# EasyEDA Pro project IMPORT-THIS-IN-KICAD.epro, schematic Circuit
Board Name: Board1; Create Date: 2026-10-03; Page Name: P1; Project Name: Submission_Velan; Schematic Name: Schematic1; Update Date: 2026-10-03; Company: EasyEDA.com; Page Size: A4; Version: V1.0
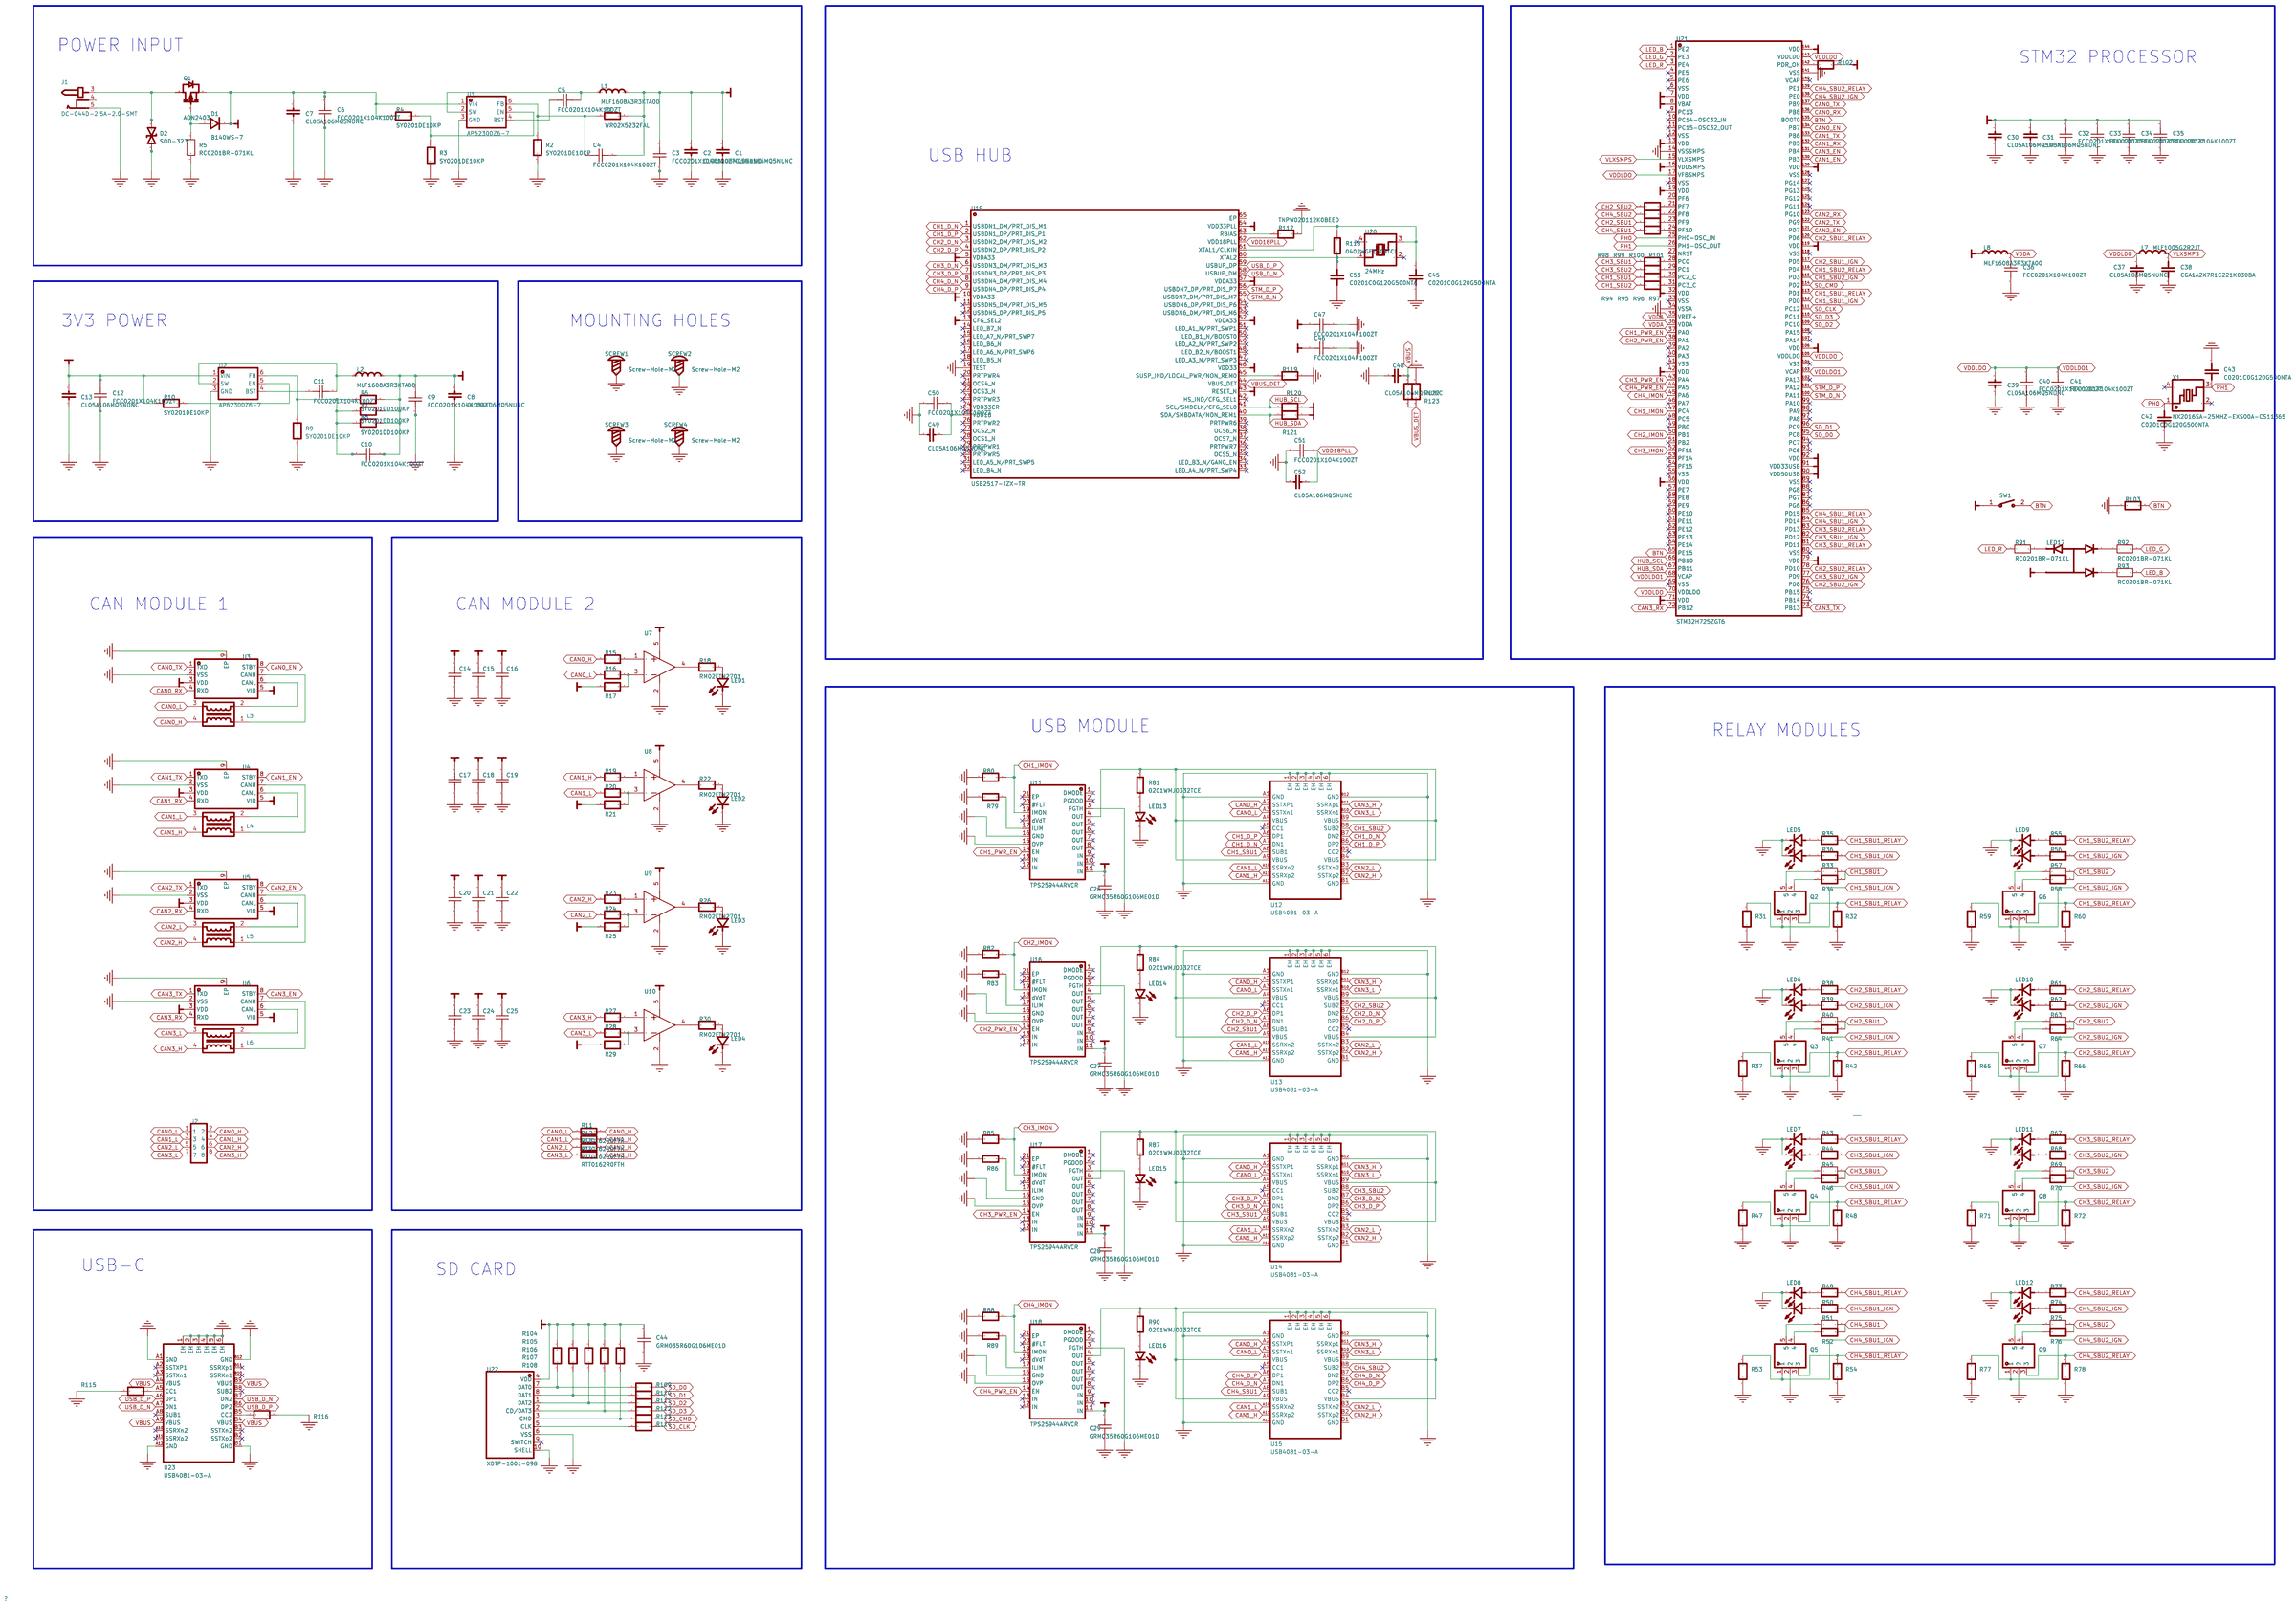
[diagram p0: schematic sheet]

## Parts
C1  10uF  [C0402]
C2  10uF  [C0402]
C3  100nF  [C0201]
C4  100nF  [C0201]
C5  100nF  [C0201]
C6  100nF  [C0201]
C7  10uF  [C0402]
C8  10uF  [C0402]
C9  100nF  [C0201]
C10  100nF  [C0201]
C11  100nF  [C0201]
C12  100nF  [C0201]
C13  10uF  [C0402]
C14  100nF  [C0201]
C15  100nF  [C0201]
C16  100nF  [C0201]
C17  100nF  [C0201]
C18  100nF  [C0201]
C19  100nF  [C0201]
C20  100nF  [C0201]
C21  100nF  [C0201]
C22  100nF  [C0201]
C23  100nF  [C0201]
C24  100nF  [C0201]
C25  100nF  [C0201]
C26  10uF  [C0201]
C27  10uF  [C0201]
C28  10uF  [C0201]
C29  10uF  [C0201]
C30  10uF  [C0402]
C31  10uF  [C0402]
C32  100nF  [C0201]
C33  100nF  [C0201]
C34  100nF  [C0201]
C35  100nF  [C0201]
C36  100nF  [C0201]
C37  10uF  [C0402]
C38  220pF  [C0201]
C39  10uF  [C0402]
C40  100nF  [C0201]
C41  100nF  [C0201]
C42  12pF  [C0201]
C43  12pF  [C0201]
C44  10uF  [C0201]
C45  12pF  [C0201]
C46  100nF  [C0201]
C47  100nF  [C0201]
C48  10uF  [C0402]
C49  10uF  [C0402]
C50  100nF  [C0201]
C51  100nF  [C0201]
C52  10uF  [C0402]
C53  12pF  [C0201]
D1  B140WS-7  [SOD-323_L1.8-W1.3-LS2.5-RD]
D2  SOD-323  [SOD-323_L1.7-W1.3-LS2.5-BI]
J1  DC-044D-2.5A-2.0-SMT  [DC-IN-SMD_DC-044D-2.5A-2.0-SMT]
J2  SSQ-104-04-T-D  [HDR-TH_8P-P2.54_SSW-104-23-F-D]
L1  3.3uH  [L0603]
L2  3.3uH  [L0603]
L3  ACM2012-900-2P-T001  [FILTER-SMD_4P-L2.0-W1.2-TL_ACM2012E]
L4  ACM2012-900-2P-T001  [FILTER-SMD_4P-L2.0-W1.2-TL_ACM2012E]
L5  ACM2012-900-2P-T001  [FILTER-SMD_4P-L2.0-W1.2-TL_ACM2012E]
L6  ACM2012-900-2P-T001  [FILTER-SMD_4P-L2.0-W1.2-TL_ACM2012E]
L7  2.2uH  [L0402]
L8  3.3uH  [L0603]
LED1  APHHS1005LSECK/J3-PF  [LED0402-RD_RED]
LED2  APHHS1005LSECK/J3-PF  [LED0402-RD_RED]
LED3  APHHS1005LSECK/J3-PF  [LED0402-RD_RED]
LED4  APHHS1005LSECK/J3-PF  [LED0402-RD_RED]
LED5  HSMF-C163  [LED-SMD_L1.6-W0.8_HSMF-C163]
LED6  HSMF-C163  [LED-SMD_L1.6-W0.8_HSMF-C163]
LED7  HSMF-C163  [LED-SMD_L1.6-W0.8_HSMF-C163]
LED8  HSMF-C163  [LED-SMD_L1.6-W0.8_HSMF-C163]
LED9  HSMF-C163  [LED-SMD_L1.6-W0.8_HSMF-C163]
LED10  HSMF-C163  [LED-SMD_L1.6-W0.8_HSMF-C163]
LED11  HSMF-C163  [LED-SMD_L1.6-W0.8_HSMF-C163]
LED12  HSMF-C163  [LED-SMD_L1.6-W0.8_HSMF-C163]
LED13  SLED-0603-H0_8MM_C9900013124  [LED0603-R-RD_RED]
LED14  SLED-0603-H0_8MM_C9900013124  [LED0603-R-RD_RED]
LED15  SLED-0603-H0_8MM_C9900013124  [LED0603-R-RD_RED]
LED16  SLED-0603-H0_8MM_C9900013124  [LED0603-R-RD_RED]
LED17  TZ1615RGB3U-Common Yang  [LED-SMD_TZ1615RGB3U-COMMON-YANG]
Q1  AON2403  [DFN-6_L2.0-W2.0-P0.65-BL-EP-1]
Q2  QS5K2TR  [SOT-23-5_L2.9-W1.6-P0.95-LS2.8-TL]
Q3  QS5K2TR  [SOT-23-5_L2.9-W1.6-P0.95-LS2.8-TL]
Q4  QS5K2TR  [SOT-23-5_L2.9-W1.6-P0.95-LS2.8-TL]
Q5  QS5K2TR  [SOT-23-5_L2.9-W1.6-P0.95-LS2.8-TL]
Q6  QS5K2TR  [SOT-23-5_L2.9-W1.6-P0.95-LS2.8-TL]
Q7  QS5K2TR  [SOT-23-5_L2.9-W1.6-P0.95-LS2.8-TL]
Q8  QS5K2TR  [SOT-23-5_L2.9-W1.6-P0.95-LS2.8-TL]
Q9  QS5K2TR  [SOT-23-5_L2.9-W1.6-P0.95-LS2.8-TL]
R1  52.3kΩ  [R0201]
R2  10kΩ  [R0201]
R3  10kΩ  [R0201]
R4  10kΩ  [R0201]
R5  1kΩ  [R0201]
R6  100kΩ  [R0201]
R7  100kΩ  [R0201]
R8  100kΩ  [R0201]
R9  10kΩ  [R0201]
R10  10kΩ  [R0201]
R11  62Ω  [R0201]
R12  62Ω  [R0201]
R13  62Ω  [R0201]
R14  62Ω  [R0201]
R15  10kΩ  [R0201]
R16  10kΩ  [R0201]
R17  100kΩ  [R0201]
R18  2.7kΩ  [R0201]
R19  10kΩ  [R0201]
R20  10kΩ  [R0201]
R21  100kΩ  [R0201]
R22  2.7kΩ  [R0201]
R23  10kΩ  [R0201]
R24  10kΩ  [R0201]
R25  100kΩ  [R0201]
R26  2.7kΩ  [R0201]
R27  10kΩ  [R0201]
R28  10kΩ  [R0201]
R29  100kΩ  [R0201]
R30  2.7kΩ  [R0201]
R31  10kΩ  [R0201]
R32  10kΩ  [R0201]
R33  1kΩ  [R0201]
R34  100Ω  [R0201]
R35  100Ω  [R0201]
R36  100Ω  [R0201]
R37  10kΩ  [R0201]
R38  100Ω  [R0201]
R39  100Ω  [R0201]
R40  1kΩ  [R0201]
R41  100Ω  [R0201]
R42  10kΩ  [R0201]
R43  100Ω  [R0201]
R44  100Ω  [R0201]
R45  1kΩ  [R0201]
R46  100Ω  [R0201]
R47  10kΩ  [R0201]
R48  10kΩ  [R0201]
R49  100Ω  [R0201]
R50  100Ω  [R0201]
R51  1kΩ  [R0201]
R52  100Ω  [R0201]
R53  10kΩ  [R0201]
R54  10kΩ  [R0201]
R55  100Ω  [R0201]
R56  100Ω  [R0201]
R57  1kΩ  [R0201]
R58  100Ω  [R0201]
R59  10kΩ  [R0201]
R60  10kΩ  [R0201]
R61  100Ω  [R0201]
R62  100Ω  [R0201]
R63  1kΩ  [R0201]
R64  100Ω  [R0201]
R65  10kΩ  [R0201]
R66  10kΩ  [R0201]
R67  100Ω  [R0201]
R68  100Ω  [R0201]
R69  1kΩ  [R0201]
R70  100Ω  [R0201]
R71  10kΩ  [R0201]
R72  10kΩ  [R0201]
R73  100Ω  [R0201]
R74  100Ω  [R0201]
R75  1kΩ  [R0201]
R76  100Ω  [R0201]
R77  10kΩ  [R0201]
R78  10kΩ  [R0201]
R79  28kΩ  [R0201]
R80  33kΩ  [R0201]
R81  3.3kΩ  [R0201]
R82  33kΩ  [R0201]
R83  28kΩ  [R0201]
R84  3.3kΩ  [R0201]
R85  33kΩ  [R0201]
R86  28kΩ  [R0201]
R87  3.3kΩ  [R0201]
R88  33kΩ  [R0201]
R89  28kΩ  [R0201]
R90  3.3kΩ  [R0201]
R91  1kΩ  [R0201]
R92  1kΩ  [R0201]
R93  1kΩ  [R0201]
R94  100kΩ  [R0201]
R95  100kΩ  [R0201]
R96  100kΩ  [R0201]
R97  100kΩ  [R0201]
R98  100kΩ  [R0201]
R99  100kΩ  [R0201]
R100  100kΩ  [R0201]
R101  100kΩ  [R0201]
R102  10kΩ  [R0201]
R103  10kΩ  [R0201]
R104  10kΩ  [R0201]
R105  10kΩ  [R0201]
R106  10kΩ  [R0201]
R107  10kΩ  [R0201]
R108  10kΩ  [R0201]
R109  0Ω  [R0201]
R110  0Ω  [R0201]
R111  0Ω  [R0201]
R112  0Ω  [R0201]
R113  0Ω  [R0201]
R114  0Ω  [R0201]
R115  10kΩ  [R0201]
R116  10kΩ  [R0201]
R117  12kΩ  [R0201]
R118  1MΩ  [R0402]
R119  10kΩ  [R0201]
R120  10kΩ  [R0201]
R121  10kΩ  [R0201]
R122  100kΩ  [R0201]
R123  100kΩ  [R0201]
SCREW1  Screw-Hole-M2  [Screw-Hole-M2]
SCREW2  Screw-Hole-M2  [Screw-Hole-M2]
SCREW3  Screw-Hole-M2  [Screw-Hole-M2]
SCREW4  Screw-Hole-M2  [Screw-Hole-M2]
SW1  TS-1809-T20  [SW-SMD_L3.9-W2.9-LS4.8SWQC_SPST]
U1  AP62300Z6-7  [SOT-563-6_L1.6-W1.2-P0.50-LS1.6-BL]
U2  AP62300Z6-7  [SOT-563-6_L1.6-W1.2-P0.50-LS1.6-BL]
U3  MCP2542FDT-E/MNY  [TDFN-8_L3.0-W2.0-P0.50-TL-EP]
U4  MCP2542FDT-E/MNY  [TDFN-8_L3.0-W2.0-P0.50-TL-EP]
U5  MCP2542FDT-E/MNY  [TDFN-8_L3.0-W2.0-P0.50-TL-EP]
U6  MCP2542FDT-E/MNY  [TDFN-8_L3.0-W2.0-P0.50-TL-EP]
U7  NCS20071XV53T2G  [SOT-553-5_L1.6-W1.2-P0.50-LS1.6-BL]
U8  NCS20071XV53T2G  [SOT-553-5_L1.6-W1.2-P0.50-LS1.6-BL]
U9  NCS20071XV53T2G  [SOT-553-5_L1.6-W1.2-P0.50-LS1.6-BL]
U10  NCS20071XV53T2G  [SOT-553-5_L1.6-W1.2-P0.50-LS1.6-BL]
U11  TPS25944ARVCR  [WQFN-20_L4.0-W3.0-P0.50-BL-EP]
U12  USB4081-03-A  [USB-SMD_USB4081-03-A]
U13  USB4081-03-A  [USB-SMD_USB4081-03-A]
U14  USB4081-03-A  [USB-SMD_USB4081-03-A]
U15  USB4081-03-A  [USB-SMD_USB4081-03-A]
U16  TPS25944ARVCR  [WQFN-20_L4.0-W3.0-P0.50-BL-EP]
U17  TPS25944ARVCR  [WQFN-20_L4.0-W3.0-P0.50-BL-EP]
U18  TPS25944ARVCR  [WQFN-20_L4.0-W3.0-P0.50-BL-EP]
U19  USB2517-JZX-TR  [QFN-64_L9.0-W9.0-P0.50-BL-EP4.8]
U20  24MHz  [CRYSTAL-SMD_4P-L3.2-W2.5-BL]
U21  STM32H725ZGT6  [LQFP-144_L20.0-W20.0-P0.50-LS22.0-BL]
U22  XDTP-1001-098  [MICRO-SD-SMD_XDTP-1001-098]
U23  USB4081-03-A  [USB-SMD_USB4081-03-A]
X1  25MHz  [CRYSTAL-SMD_4P-L2.0-W1.6-BL]

## Library data of the parts
C1 C2 C7 C8 C13 C30 C31 C37 C39 C48 C49 C52 = CL05A106MQ5NUNC: Capacitance:10uF Tolerance:±20% Tolerance:±20% Voltage Rating:6.3V Temperature Coefficient:X5R; LCSC Part Name: 10uF ±20% 6.3V; Supplier Part: C15525; Manufacturer: SAMSUNG(三星); Supplier Footprint: 0402; JLCPCB Part Class: Basic Part; Datasheet: https://item.szlcsc.com/datasheet/CL05A106MQ5NUNC/16204.html; Supplier: LCSC; Tolerance: ±20%; Voltage Rating: 6.3V; Temperature Coefficient: X5R
C3-C6 C9-C12 C14-C25 C32-C36 C40 C41 C46 C47 C50 C51 = FCC0201X104K100ZT: Capacitance:100nF Tolerance:±10% Tolerance:±10% Voltage Rating:10V Temperature Coefficient:X5R Operating Temperature:-55℃~+85℃ Operating Temperature:-55℃~+85℃; LCSC Part Name: 100nF ±10% 10V; Supplier Part: C7419414; Manufacturer: FOJAN(富捷); Supplier Footprint: 0201; JLCPCB Part Class: Extended Part; Datasheet: https://item.szlcsc.com/datasheet/FCC0201X104K100ZT/8393396.html; Supplier: LCSC; Tolerance: ±10%; Voltage Rating: 10V; Temperature Coefficient: X5R; Operating Temperature: -55℃~+85℃
C26-C29 C44 = GRM035R60G106ME01D: Capacitance:10uF Tolerance:±20% Tolerance:±20% Voltage Rating:4V Temperature Coefficient:X5R Operating Temperature:-55℃~+85℃ Operating Temperature:-55℃~+85℃; LCSC Part Name: 10uF ±20% 4V; Supplier Part: C53260764; Manufacturer: muRata(村田); Supplier Footprint: 0201; JLCPCB Part Class: Extended Part; Datasheet: https://item.szlcsc.com/datasheet/GRM035R60G106ME01D/56318658.html; Supplier: LCSC; Tolerance: ±20%; Voltage Rating: 4V; Temperature Coefficient: X5R; Operating Temperature: -55℃~+85℃
C38 = CGA1A2X7R1C221K030BA: Capacitance: Tolerance:±10% Tolerance:±10% Voltage Rated: Temperature Coefficient:; LCSC Part Name: 220pF ±10% 16V; Supplier Part: C2174633; Manufacturer: TDK; Supplier Footprint: 0201; JLCPCB Part Class: Extended Part; Datasheet: https://atta.szlcsc.com/upload/public/pdf/source/20210430/BD8671736ED62E65BA506F30C3AAED50.pdf; Supplier: LCSC; Tolerance: ±10%
C42 C43 C45 C53 = C0201C0G120G500NTA: Capacitance:12pF Tolerance:±2% Tolerance:±2% Voltage Rating:50V Temperature Coefficient:C0G; LCSC Part Name: 12pF ±2% 50V; Supplier Part: C778215; Manufacturer: EYANG(宇阳科技); Supplier Footprint: 0201; JLCPCB Part Class: Extended Part; Datasheet: https://item.szlcsc.com/datasheet/C0201C0G120G500NTA/826909.html; Supplier: LCSC; Tolerance: ±2%; Voltage Rating: 50V; Temperature Coefficient: C0G
D1 = B140WS-7: Diode Configuration:1 Independent Voltage - Forward(Vf@If):620mV@1A Voltage - DC Reverse(Vr):40V Current - Rectified:1A Reverse Leakage Current (Ir):50uA@40V Operating Junction Temperature Range:-40℃~+125℃ Operating Junction Temperature Range:-40℃~+125℃ N; LCSC Part Name: 电压:40V 电流:1A; Supplier Part: C95171; Manufacturer: DIODES(美台); Supplier Footprint: SOD-323; JLCPCB Part Class: Extended Part; Datasheet: https://item.szlcsc.com/datasheet/B140WS-7/96372.html; Supplier: LCSC; Diode Configuration: 1 Independent; Voltage - Forward(Vf@If): 620mV@1A; Voltage - DC Reverse(Vr): 40V; Current - Rectified: 1A; Reverse Leakage Current (Ir): 50uA@40V; Operating Junction Temperature Range: -40℃~+125℃; Non-Repetitive Peak Forward Surge Current: 3A
D2 = SOD-323: Supplier Part: C9900016728; JLCPCB Part Class: Extended Part; Supplier: LCSC
J1 = DC-044D-2.5A-2.0-SMT: Connector Type:DC Power Jack Mounting Type:Panel Mount Inside Contact Diameter:2mm Outside Contact Diameter:6mm Current Rating:2.5A Voltage Rating (Max):24V Body Height:7mm Length:13.5mm Width:11.6mm Operating Temperature:-20℃~+70℃ Operating Temperature:-; LCSC Part Name: DC电源插座 内径:2mm 外径:6mm; Supplier Part: C397342; Manufacturer: XKB Connection(中国星坤); Supplier Footprint: SMD; JLCPCB Part Class: Extended Part; Datasheet: https://item.szlcsc.com/datasheet/DC-044D-2.5A-2.0-SMT/378920.html; Supplier: LCSC; Connector Type: DC Power Jack; Mounting Type: Panel Mount; Inside Contact Diameter: 2mm; Outside Contact Diameter: 6mm; Current Rating: 2.5A; Voltage Rating (Max): 24V; Body Height: 7mm; Length: 13.5mm; Width: 11.6mm; Operating Temperature: -20℃~+70℃
J2 = SSQ-104-04-T-D: Pitch:2.54mm Row Spacing:2.54mm Mounting Type:Through Hole Number of Rows:2 Number of Positions:8P Voltage Rating (Max):- Insulation Height:8.51mm Contact Plating:Tin Operating Temperature:-55℃~+105℃ Operating Temperature:-55℃~+105℃; LCSC Part Name: 间距:2.54mm 直插; Supplier Part: C6685839; Manufacturer: SAMTEC; Supplier Footprint: 插件,P=2.54mm; JLCPCB Part Class: Extended Part; Datasheet: https://item.szlcsc.com/datasheet/SSQ-104-04-T-D/7641055.html; Supplier: LCSC; Pitch: 2.54mm; Row Spacing: 2.54mm; Mounting Type: Through Hole; Number of Rows: 2; Number of Positions: 8P; Insulation Height: 8.51mm; Contact Plating: Tin; Operating Temperature: -55℃~+105℃
L1 L2 L8 = MLF1608A3R3KTA00: Inductance:3.3uH Tolerance:±10% Tolerance:±10% Current Rating:30mA Current - Saturation (Isat):- DC Resistance(DCR):550mΩ Q @ Frequency:35@10MHz Frequency - Self Resonant:65MHz Ratings:-; LCSC Part Name: 3.3uH ±10%; Supplier Part: C574026; Manufacturer: TDK; Supplier Footprint: 0603; JLCPCB Part Class: Extended Part; Datasheet: https://item.szlcsc.com/datasheet/MLF1608A3R3KTA00/601954.html; Supplier: LCSC; Tolerance: ±10%; Current Rating: 30mA; DC Resistance(DCR): 550mΩ; Q @ Frequency: 35@10MHz; Frequency - Self Resonant: 65MHz
L3-L6 = ACM2012-900-2P-T001: Number of Lines:2 Inductance @ Frequency:- Current Rating:400mA Impedance @ Frequency:90Ω@100MHz Voltage Rating - DC:50V Voltage Withstand:- DC Resistance(DCR):190mΩ Operating Temperature:-40℃~+105℃ Operating Temperature:-40℃~+105℃ Insulation Resistance(I; LCSC Part Name: 两路 贴片共模滤波器 阻抗90Ω@100MHz; Supplier Part: C307642; Manufacturer: TDK; Supplier Footprint: SMD,2x1.2mm; JLCPCB Part Class: Extended Part; Datasheet: https://item.szlcsc.com/datasheet/ACM2012-900-2P-T001/291316.html; Supplier: LCSC; Number of Lines: 2; Current Rating: 400mA; Impedance @ Frequency: 90Ω@100MHz; Voltage Rating - DC: 50V; DC Resistance(DCR): 190mΩ; Operating Temperature: -40℃~+105℃; Insulation Resistance(IR): 10MΩ
L7 = MLF1005G2R2JT: Inductance: Tolerance:±5% Tolerance:±5% Rated Current: Saturation Current (Isat):- DC Resistance (DCR): Q @ Freq:30@10MHz Frequency - Self Resonant:80MHz Ratings:; LCSC Part Name: 2.2uH ±5%; Supplier Part: C2049077; Manufacturer: TDK; Supplier Footprint: 0402; JLCPCB Part Class: Extended Part; Datasheet: https://atta.szlcsc.com/upload/public/pdf/source/20210630/1671E6FFEDD46C2DFBE7E714E5EDDF5E.pdf; Supplier: LCSC; Tolerance: ±5%; Q @ Freq: 30@10MHz; Frequency - Self Resonant: 80MHz
LED1-LED4 = APHHS1005LSECK/J3-PF: Lamp Holder Type:- Illumination Color:Red Voltage - Forward(Vf):1.8V Voltage - Forward(Vf):1.8V Power(Watts):84mW Forward Current:2mA Wavelength - Dominant:625nm Wavelength - Dominant:625nm Peak Wavelength:640nm Diode Configuration:Discrete Diode Lens Col; LCSC Part Name: 1.0x0.5 mm贴片式芯片LED灯; Supplier Part: C5354976; Manufacturer: Kingbright(今台); Supplier Footprint: 0402; JLCPCB Part Class: Extended Part; Datasheet: https://item.szlcsc.com/datasheet/APHHS1005LSECK%252FJ3-PF/6154435.html; Supplier: LCSC; Illumination Color: Red; Voltage - Forward(Vf): 1.8V; Power(Watts): 84mW; Forward Current: 2mA; Wavelength - Dominant: 625nm; Peak Wavelength: 640nm; Diode Configuration: Discrete Diode; Lens Color: Water Clear; Luminous Intensity: 80mcd; Viewing Angle: 120°; Operating Temperature: -40℃~+85℃
LED5-LED12 = HSMF-C163: Lamp Holder Type:1.6mm x 0.8mm square LED Illumination Color:Red, Emerald Green Voltage - Forward(Vf):1.9V；3.4V Voltage - Forward(Vf):1.9V；3.4V Power(Watts):48mW；38mW Test Current:10mA；20mA Wavelength - Dominant:626nm；525nm Wavelength - Dominant:626nm；525; LCSC Part Name: 小型双色表面贴装芯片LED，适用于手机和移动设备背光及指示，有多种颜色组合，兼容回流焊; Supplier Part: C6273803; Manufacturer: Broadcom(博通); Supplier Footprint: 0603; JLCPCB Part Class: Extended Part; Datasheet: https://item.szlcsc.com/datasheet/HSMF-C163/7219819.html; Supplier: LCSC; Lamp Holder Type: 1.6mm x 0.8mm square LED; Illumination Color: Red, Emerald Green; Voltage - Forward(Vf): 1.9V；3.4V; Power(Watts): 48mW；38mW; Test Current: 10mA；20mA; Wavelength - Dominant: 626nm；525nm; Peak Wavelength: 637nm；523nm; Lens Color: White Lens; Luminous Intensity: 90mcd；45mcd; Viewing Angle: 120°; Operating Temperature: -40℃~+85℃
LED13-LED16 = SLED-0603-H0_8MM_C9900013124: LCSC Part Name: SLED-0603-H0_8MM; Supplier Part: C9900013124; Manufacturer Part: SLED-0603-H0_8MM; Supplier Footprint: LED0603_Red; JLCPCB Part Class: Extended Part; Supplier: LCSC
LED17 = TZ1615RGB3U-Common Yang: Illumination Color:Red, Emerald Green, Blue Voltage - Forward(Vf):2.6V~3V；1.8V~2.1V；2.4V~2.8V Voltage - Forward(Vf):2.6V~3V；1.8V~2.1V；2.4V~2.8V Power(Watts):60mW；90mW；90mW Forward Current:30mA Wavelength - Dominant:520nm~523nm；466nm~469nm；620nm~625nm Wave; LCSC Part Name: 红灯,翠绿，蓝灯 光强200mcd;1000mcd;300mcd; Supplier Part: C5331632; Manufacturer: TUOZHAN(拓展光电); Supplier Footprint: SMD,1.5x1.6mm; JLCPCB Part Class: Extended Part; Datasheet: https://item.szlcsc.com/datasheet/TZ1615RGB3U-Common%2520Yang/6091971.html; Supplier: LCSC; Illumination Color: Red, Emerald Green, Blue; Voltage - Forward(Vf): 2.6V~3V；1.8V~2.1V；2.4V~2.8V; Power(Watts): 60mW；90mW；90mW; Forward Current: 30mA; Wavelength - Dominant: 520nm~523nm；466nm~469nm；620nm~625nm; Luminous Intensity: 1000mcd；300mcd；200mcd; Viewing Angle: 120°; Operating Temperature: -40℃~+80℃
Q1 = AON2403: Number:1 P-Channel Drain to Source Voltage:12V Current - Continuous Drain(Id):8A RDS(on):21mΩ@4.5V Pd - Power Dissipation:2.8W Gate Threshold Voltage (Vgs(th)):900mV Gate Charge(Qg):18nC@4.5V Input Capacitance(Ciss):1.37nF Reverse Transfer Capacitance (Cr; LCSC Part Name: 1个P沟道 耐压:12V; Supplier Part: C2931059; Manufacturer: AOS; Supplier Footprint: DFN-6-EP(2x2); JLCPCB Part Class: Extended Part; Datasheet: https://item.szlcsc.com/datasheet/AON2403/3270195.html; Supplier: LCSC; Number: 1 P-Channel; Drain to Source Voltage: 12V; Current - Continuous Drain(Id): 8A; RDS(on): 21mΩ@4.5V; Pd - Power Dissipation: 2.8W; Gate Threshold Voltage (Vgs(th)): 900mV; Gate Charge(Qg): 18nC@4.5V; Input Capacitance(Ciss): 1.37nF; Reverse Transfer Capacitance (Crss@Vds): 258pF; Operating Temperature: -55℃~+150℃; Type: P-Channel; Output Capacitance(Coss): 350pF; Vgs: ±8V
Q2-Q9 = QS5K2TR: Number:2 N-Channel Drain to Source Voltage:30V Current - Continuous Drain(Id):2A RDS(on):154mΩ@2.5V Pd - Power Dissipation:1.25W Gate Threshold Voltage (Vgs(th)):1.5V Gate Charge(Qg):3.9nC@15V Input Capacitance(Ciss):175pF Reverse Transfer Capacitance (Cr; LCSC Part Name: 2个N沟道 耐压:30V 电流:2A; Supplier Part: C2889124; Manufacturer: ROHM(罗姆); Supplier Footprint: SOT-23-5; JLCPCB Part Class: Extended Part; Datasheet: https://item.szlcsc.com/datasheet/QS5K2TR/3109776.html; Supplier: LCSC; Number: 2 N-Channel; Drain to Source Voltage: 30V; Current - Continuous Drain(Id): 2A; RDS(on): 154mΩ@2.5V; Pd - Power Dissipation: 1.25W; Gate Threshold Voltage (Vgs(th)): 1.5V; Gate Charge(Qg): 3.9nC@15V; Input Capacitance(Ciss): 175pF; Reverse Transfer Capacitance (Crss@Vds): 25pF; Operating Temperature: -55℃~+150℃; Configuration: Common source; Type: N-Channel; Output Capacitance(Coss): 50pF; Vgs: ±12V
R1 = WR02X5232FAL: Type:Thick Film Resistors Resistance: Tolerance:±1% Tolerance:±1% Power(Watts): Overload Voltage (Max): Temperature Coefficient:±200ppm/℃ Temperature Coefficient:±200ppm/℃ Operating Temperature Range:-55℃~+125℃ Operating Temperature Range:-55℃~+125℃; LCSC Part Name: 厚膜电阻 52.3kΩ ±1% 50mW; Supplier Part: C180337; Manufacturer: Walsin(华新科); Supplier Footprint: 0201; JLCPCB Part Class: Extended Part; Datasheet: https://atta.szlcsc.com/upload/public/pdf/source/20190904/C424794_2044F9DA5DA8A0E175B1DF2F17C06127.pdf; Supplier: LCSC; Type: Thick Film Resistors; Tolerance: ±1%; Temperature Coefficient: ±200ppm/℃; Operating Temperature Range: -55℃~+125℃
R2-R4 R9 R10 R15 R16 R19 R20 R23 R24 R27 R28 R31 R32 R37 R42 R47 R48 R53 R54 R59 R60 R65 R66 R71 R72 R77 R78 R102-R108 R115 R116 R119-R121 = SY0201DE10KP: Type:Thick Film Resistors Resistance: Tolerance:±0.5% Tolerance:±0.5% Power(Watts):- Overload Voltage (Max):- Temperature Coefficient:±50ppm/℃ Temperature Coefficient:±50ppm/℃ Operating Temperature Range:-55℃~+125℃ Operating Temperature Range:-55℃~+125℃; LCSC Part Name: 厚膜电阻 10kΩ ±0.5%; Supplier Part: C2763758; Manufacturer: SANYEAR(叁叶源); Supplier Footprint: 0201; JLCPCB Part Class: Extended Part; Datasheet: https://atta.szlcsc.com/upload/public/pdf/source/20210413/C2763786_98157E1BD2D9D1A8B4147C58C12D38F2.pdf; Supplier: LCSC; Type: Thick Film Resistors; Tolerance: ±0.5%; Temperature Coefficient: ±50ppm/℃; Operating Temperature Range: -55℃~+125℃
R5 R33 R40 R45 R51 R57 R63 R69 R75 R91-R93 = RC0201BR-071KL: Type:Thick Film Resistor Resistance:1kΩ Tolerance:±0.1% Tolerance:±0.1% Power(Watts):50mW Temperature Coefficient:±200ppm/℃ Temperature Coefficient:±200ppm/℃ Operating Temperature:-55℃~+125℃ Operating Temperature:-55℃~+125℃; LCSC Part Name: 厚膜电阻 1kΩ ±0.1% 50mW; Supplier Part: C20161128; Manufacturer: YAGEO(国巨); Supplier Footprint: 0201; JLCPCB Part Class: Extended Part; Datasheet: https://item.szlcsc.com/datasheet/RC0201BR-071KL/21487095.html; Supplier: LCSC; Type: Thick Film Resistor; Tolerance: ±0.1%; Power(Watts): 50mW; Temperature Coefficient: ±200ppm/℃; Operating Temperature: -55℃~+125℃
R6-R8 R17 R21 R25 R29 R94-R101 R122 R123 = SY0201DD100KP: Type:Thick Film Resistors Resistance:100kΩ Tolerance:±0.5% Tolerance:±0.5% Power(Watts):- Voltage-Supply(Max):- Temperature Coefficient:±25ppm/℃ Temperature Coefficient:±25ppm/℃ Operating Temperature:-55℃~+125℃ Operating Temperature:-55℃~+125℃; LCSC Part Name: 厚膜电阻 100kΩ ±0.5%; Supplier Part: C2763725; Manufacturer: SANYEAR(叁叶源); Supplier Footprint: 0201; JLCPCB Part Class: Extended Part; Datasheet: https://atta.szlcsc.com/upload/public/pdf/source/20210413/C2763786_98157E1BD2D9D1A8B4147C58C12D38F2.pdf; Supplier: LCSC; Type: Thick Film Resistors; Tolerance: ±0.5%; Temperature Coefficient: ±25ppm/℃; Operating Temperature: -55℃~+125℃
R11-R14 = RTT0162R0FTH: Type:Thick Film Resistor Resistance:62Ω Tolerance:±1% Tolerance:±1% Power(Watts):50mW Voltage-Supply(Max):25V Temperature Coefficient:±200ppm/℃ Temperature Coefficient:±200ppm/℃ Operating Temperature:-55℃~+125℃ Operating Temperature:-55℃~+125℃; LCSC Part Name: 厚膜电阻 62Ω ±1% 50mW; Supplier Part: C158403; Manufacturer: RALEC(旺诠); Supplier Footprint: 0201; JLCPCB Part Class: Extended Part; Datasheet: https://item.szlcsc.com/datasheet/RTT0162R0FTH/169756.html; Supplier: LCSC; Type: Thick Film Resistor; Tolerance: ±1%; Power(Watts): 50mW; Voltage-Supply(Max): 25V; Temperature Coefficient: ±200ppm/℃; Operating Temperature: -55℃~+125℃
R18 R22 R26 R30 = RM02FTN2701: Resistance:2.7kΩ Tolerance:±1% Tolerance:±1% Power(Watts):50mW Temperature Coefficient:±200ppm/℃ Temperature Coefficient:±200ppm/℃; LCSC Part Name: 2.7kΩ ±1% 50mW; Supplier Part: C239998; Manufacturer: 大毅科技; Supplier Footprint: 0201; JLCPCB Part Class: Extended Part; Datasheet: https://item.szlcsc.com/datasheet/RM02FTN2701/239089.html; Supplier: LCSC; Tolerance: ±1%; Power(Watts): 50mW; Temperature Coefficient: ±200ppm/℃
R34-R36 R38 R39 R41 R43 R44 R46 R49 R50 R52 R55 R56 R58 R61 R62 R64 R67 R68 R70 R73 R74 R76 = CR0201J100RQ15Z: Type:Thick Film Resistor Resistance:100Ω Tolerance:±5% Tolerance:±5% Power(Watts):50mW Voltage-Supply(Max):25V Temperature Coefficient:±200ppm/℃ Temperature Coefficient:±200ppm/℃ Operating Temperature:-55℃~+155℃ Operating Temperature:-55℃~+155℃; LCSC Part Name: 厚膜电阻 100Ω ±5% 50mW; Supplier Part: C881230; Manufacturer: EVER OHMS(天二科技); Supplier Footprint: 0201; JLCPCB Part Class: Extended Part; Datasheet: https://item.szlcsc.com/datasheet/CR0201J100RQ15Z/944145.html; Supplier: LCSC; Type: Thick Film Resistor; Tolerance: ±5%; Power(Watts): 50mW; Voltage-Supply(Max): 25V; Temperature Coefficient: ±200ppm/℃; Operating Temperature: -55℃~+155℃
R79 R83 R86 R89 = RC-01W2802FT: Type:Thick Film Resistor Resistance:28kΩ Tolerance:±1% Tolerance:±1% Power(Watts):50mW Voltage-Supply(Max):25V Temperature Coefficient:±200ppm/℃ Temperature Coefficient:±200ppm/℃ Operating Temperature:-55℃~+125℃ Operating Temperature:-55℃~+125℃; LCSC Part Name: 厚膜电阻 28kΩ ±1% 50mW; Supplier Part: C320804; Manufacturer: FH(风华); Supplier Footprint: 0201; JLCPCB Part Class: Extended Part; Datasheet: https://item.szlcsc.com/datasheet/RC-01W2802FT/301709.html; Supplier: LCSC; Type: Thick Film Resistor; Tolerance: ±1%; Power(Watts): 50mW; Voltage-Supply(Max): 25V; Temperature Coefficient: ±200ppm/℃; Operating Temperature: -55℃~+125℃
R80 R82 R85 R88 = AC0201FR-0733KL: Type:Thick Film Resistors Resistance: Tolerance:±1% Tolerance:±1% Power(Watts): Overload Voltage (Max): Temperature Coefficient:±200ppm/℃ Temperature Coefficient:±200ppm/℃ Operating Temperature Range:-55℃~+155℃ Operating Temperature Range:-55℃~+155℃; LCSC Part Name: 厚膜电阻 33kΩ ±1% 50mW; Supplier Part: C226512; Manufacturer: YAGEO(国巨); Supplier Footprint: 0201; JLCPCB Part Class: Extended Part; Datasheet: https://atta.szlcsc.com/upload/public/pdf/source/20200817/C226512_B606B44C9E13D1181CAA89D1E1529F40.pdf; Supplier: LCSC; Type: Thick Film Resistors; Tolerance: ±1%; Temperature Coefficient: ±200ppm/℃; Operating Temperature Range: -55℃~+155℃
R81 R84 R87 R90 = 0201WMJ0332TCE: Type:Thick Film Resistors Resistance:3.3kΩ Tolerance:±5% Tolerance:±5% Power(Watts): Overload Voltage (Max): Temperature Coefficient:±200ppm/℃ Temperature Coefficient:±200ppm/℃ Operating Temperature Range:-55℃~+155℃ Operating Temperature Range:-55℃~+155℃; LCSC Part Name: 3.3kΩ ±5% 50mW 厚膜电阻; Supplier Part: C25843; Manufacturer: UNI-ROYAL(厚声); Supplier Footprint: 0201; JLCPCB Part Class: Extended Part; Datasheet: https://atta.szlcsc.com/upload/public/pdf/source/20200306/C422600_1E6D84923E4A46A82E41ADD87F860B5C.pdf; Supplier: LCSC; Type: Thick Film Resistors; Tolerance: ±5%; Temperature Coefficient: ±200ppm/℃; Operating Temperature Range: -55℃~+155℃
R109-R114 = CR0201J0R00Q15Z: Type:Thick Film Resistors Resistance: Tolerance:±5% Tolerance:±5% Power(Watts):- Operating Temperature Range:-55℃~+155℃ Operating Temperature Range:-55℃~+155℃; LCSC Part Name: 厚膜电阻 0Ω ±5%; Supplier Part: C881221; Manufacturer: EVER OHMS(天二科技); Supplier Footprint: 0201; JLCPCB Part Class: Extended Part; Datasheet: https://atta.szlcsc.com/upload/public/pdf/source/20201014/C881429_ABC29D63C8D6A11EB63D87348B25AA7B.pdf; Supplier: LCSC; Type: Thick Film Resistors; Tolerance: ±5%; Operating Temperature Range: -55℃~+155℃
R117 = TNPW020112K0BEED: Type:Thin Film Resistor Resistance:12kΩ Tolerance:±0.1% Tolerance:±0.1% Power(Watts):75mW Voltage-Supply(Max):25V Temperature Coefficient:±25ppm/℃ Temperature Coefficient:±25ppm/℃ Operating Temperature:-55℃~+155℃ Operating Temperature:-55℃~+155℃; LCSC Part Name: 薄膜电阻 12kΩ ±0.1% 75mW; Supplier Part: C1857712; Manufacturer: VISHAY(威世); Supplier Footprint: 0201; JLCPCB Part Class: Extended Part; Datasheet: https://item.szlcsc.com/datasheet/TNPW020112K0BEED/1948525.html; Supplier: LCSC; Type: Thin Film Resistor; Tolerance: ±0.1%; Power(Watts): 75mW; Voltage-Supply(Max): 25V; Temperature Coefficient: ±25ppm/℃; Operating Temperature: -55℃~+155℃
R118 = 0402WGF1004TCE: Type:Thick Film Resistor Resistance:1MΩ Tolerance:±1% Tolerance:±1% Power(Watts):62.5mW Voltage-Supply(Max):50V Temperature Coefficient:±100ppm/℃ Temperature Coefficient:±100ppm/℃ Operating Temperature:-55℃~+155℃ Operating Temperature:-55℃~+155℃; LCSC Part Name: 1MΩ ±1% 62.5mW 厚膜电阻; Supplier Part: C26083; Manufacturer: UNI-ROYAL(厚声); Supplier Footprint: 0402; JLCPCB Part Class: Basic Part; Datasheet: https://item.szlcsc.com/datasheet/0402WGF1004TCE/26826.html; Supplier: LCSC; Type: Thick Film Resistor; Tolerance: ±1%; Power(Watts): 62.5mW; Voltage-Supply(Max): 50V; Temperature Coefficient: ±100ppm/℃; Operating Temperature: -55℃~+155℃
SCREW1-SCREW4 = Screw-Hole-M2: Supplier Footprint: 插件
SW1 = TS-1809-T20: Supplier Part: C9900021414; Supplier Footprint: SWQC_SPST_2P; JLCPCB Part Class: Extended Part; Supplier: LCSC
U1 U2 = AP62300Z6-7: Function:Step-down type Voltage - Supply:4.2V~18V Voltage - Supply:4.2V~18V Output Voltage:800mV~7V Output Voltage:800mV~7V Output Current:3A Frequency - Switching:750kHz Frequency - Switching:750kHz Operating Temperature:-40℃~+125℃ Operating Temperature:; LCSC Part Name: 降压型 3A 4.2V~18V; Supplier Part: C5250745; Manufacturer: DIODES(美台); Supplier Footprint: SOT-563; JLCPCB Part Class: Extended Part; Datasheet: https://item.szlcsc.com/datasheet/AP62300Z6-7/5966438.html; Supplier: LCSC; Function: Step-down type; Voltage - Supply: 4.2V~18V; Output Voltage: 800mV~7V; Output Current: 3A; Frequency - Switching: 750kHz; Operating Temperature: -40℃~+125℃; Synchronous Rectifier: Yes; Number of Outputs: 1; Topology: Buck; Quiescent Current: 155uA; Switch tube (built-in/external): Built-in; Output Type: Adjustable; Features: Light load efficient mode；Cycle-by-cycle current limiting；Overcurrent Protection；EMI optimization (spread spectrum)；Hiccup current limiting
U3-U6 = MCP2542FDT-E/MNY: Type:CAN FD Transceiver Data Rate:8Mbps Voltage - Supply:4.5V~5.5V Voltage - Supply:4.5V~5.5V Current - Supply:70mA Operating Temperature:-40℃~+125℃ Operating Temperature:-40℃~+125℃ Number of Channels:1 Quiescent Supply Current:16uA Features:Short-Circuit; LCSC Part Name: 带有唤醒模式选项的CAN FD收发器; Supplier Part: C114028; Manufacturer: MICROCHIP(美国微芯); Supplier Footprint: TDFN-8-EP(2x3); JLCPCB Part Class: Extended Part; Datasheet: https://item.szlcsc.com/datasheet/MCP2542FDT-E%252FMNY/115267.html; Supplier: LCSC; Type: CAN FD Transceiver; Data Rate: 8Mbps; Voltage - Supply: 4.5V~5.5V; Current - Supply: 70mA; Operating Temperature: -40℃~+125℃; Number of Channels: 1; Quiescent Supply Current: 16uA; Features: Short-Circuit  Protection；Wake-up function；Thermal shutdown protection；Undervoltage Protection；ESD protection；TXD dominant timeout；Low-power mode；Bus fault protection
U7-U10 = NCS20071XV53T2G: Number of Channels:1 Rail to Rail:Rail-to-rail output Gain Bandwidth Product:3MHz Vos - Input Offset Voltage:4.5mV Input Offset Voltage Drift(Vos TC):4uV/℃ Slew Rate:2.8V/us Ib - Input Bias Current:200pA Input Offset Current(Ios):2pA Input Voltage Noise D; LCSC Part Name: Operational Amplifier,Wide supply range,3MHz CMOS Op-Amp; Supplier Part: C5209282; Manufacturer: onsemi(安森美); Supplier Footprint: SOT-553; JLCPCB Part Class: Extended Part; Datasheet: https://item.szlcsc.com/datasheet/NCS20071XV53T2G/5902129.html; Supplier: LCSC; Number of Channels: 1; Rail to Rail: Rail-to-rail output; Gain Bandwidth Product: 3MHz; Vos - Input Offset Voltage: 4.5mV; Input Offset Voltage Drift(Vos TC): 4uV/℃; Slew Rate: 2.8V/us; Ib - Input Bias Current: 200pA; Input Offset Current(Ios): 2pA; Input Voltage Noise Density: 30nV/√Hz@1kHz; Common Mode Rejection Ratio(CMRR): 135dB; Quiescent Current: 420uA; Output Current: 50mA; Operating Temperature: -40℃~+125℃; Single supply: 2.7V~36V; Dual Supply: -18V~-1.35V；1.35V~18V; Features: ESD protection
U11 U16-U18 = TPS25944ARVCR: Output Type:Open-drain Voltage - Supply:2.7V~18V Voltage - Supply:2.7V~18V Reset Active Level:Active Low Number of Voltages Monitored:1 Reset Timeout:220us Operating Temperature:-40℃~+85℃ Operating Temperature:-40℃~+85℃ Function:Watchdog timer Quiescent C; LCSC Part Name: 2.7V至18V工作电压eFuse电源多路复用器，具备保护功能和双向电流控制; Supplier Part: C140313; Manufacturer: TI(德州仪器); Supplier Footprint: WQFN-20-EP(3x4); JLCPCB Part Class: Extended Part; Datasheet: https://www.ti.com/cn/lit/ds/symlink/tps25942a.pdf; Supplier: LCSC; Output Type: Open-drain; Voltage - Supply: 2.7V~18V; Reset Active Level: Active Low; Number of Voltages Monitored: 1; Reset Timeout: 220us; Operating Temperature: -40℃~+85℃; Function: Watchdog timer; Quiescent Current: 200uA
U12-U15 U23 = USB4081-03-A: Supplier Part: C7469868; Supplier Footprint: 插件; JLCPCB Part Class: Extended Part; Datasheet: https://item.szlcsc.com/datasheet/USB4081-03-A/8520767.html; Supplier: LCSC
U19 = USB2517-JZX-TR: type:Hub USB Protocol:USB 2.0 Data Rate:480Mbps Voltage - Supply:- Voltage - Supply:- Operating Temperature:- Operating Temperature:- Memory Interface:I2C Current - Supply:- Quiescent Supply Current:- Number of Channels:7 Features:Programmable signal driv; LCSC Part Name: USB 2.0高速7端口集线器控制器; Supplier Part: C626668; Manufacturer: MICROCHIP(美国微芯); Supplier Footprint: QFN-64-EP(9x9); JLCPCB Part Class: Extended Part; Datasheet: https://item.szlcsc.com/datasheet/USB2517-JZX-TR/656575.html; Supplier: LCSC; type: Hub; USB Protocol: USB 2.0; Data Rate: 480Mbps; Memory Interface: I2C; Number of Channels: 7; Features: Programmable signal drive；Internal regulator；Port power switch control；ESD protection；Power-on reset
U20 = 24MHz: Supplier Part: C9900010233; Supplier Footprint: 3225; JLCPCB Part Class: Extended Part; Supplier: LCSC
U21 = STM32H725ZGT6: CPU Core:ARM Cortex-M7 CPU Maximum Speed:550MHz Core Size:32 Bit Program Storage Size:1MB Program Memory Type:FLASH RAM Size:564KB EEPROM:- Number of I/O:97 Oscillator Type:Built-in Voltage - Supply:1.62V~3.6V Voltage - Supply:1.62V~3.6V Operating Tempera; LCSC Part Name: 高性能和带 DP-FPU 的 DSP、1 MByte 闪存的 Arm Cortex-M7 微控制器、564 KBytes RAM、550 MHz CPU、L1 缓存、外部内存接口、SMPS、部分外设子集; Supplier Part: C730156; Manufacturer: ST(意法半导体); Supplier Footprint: LQFP-144(20x20); JLCPCB Part Class: Extended Part; Datasheet: https://item.szlcsc.com/datasheet/STM32H725ZGT6/778111.html; Supplier: LCSC; CPU Core: ARM Cortex-M7; CPU Maximum Speed: 550MHz; Core Size: 32 Bit; Program Storage Size: 1MB; Program Memory Type: FLASH; RAM Size: 564KB; Number of I/O: 97; Oscillator Type: Built-in; Voltage - Supply: 1.62V~3.6V; Operating Temperature: -40℃~+85℃
U22 = XDTP-1001-098: Card Connection Mode:Push-Push Card Type:MicroSD Card (TF Card) Connector Type:Connector and Ejector Additional Card Detection Pins:No Height Above Board:1.85mm Operating Temperature:-45℃~+80℃ Operating Temperature:-45℃~+80℃; LCSC Part Name: 自弹式 MicroSD卡(TF卡) 卡座; Supplier Part: C7498123; Manufacturer: LX(连欣科技); Supplier Footprint: SMD; JLCPCB Part Class: Extended Part; Datasheet: https://item.szlcsc.com/datasheet/XDTP-1001-098/8568565.html; Supplier: LCSC; Card Connection Mode: Push-Push; Card Type: MicroSD Card (TF Card); Connector Type: Connector and Ejector; Additional Card Detection Pins: No; Height Above Board: 1.85mm; Operating Temperature: -45℃~+80℃
X1 = NX2016SA-25MHZ-EXS00A-CS11365: Frequency:25MHz Normal temperature Frequency Tolerance:±30ppm Normal temperature Frequency Tolerance:±30ppm Load Capacitance: Frequency Stability:±40ppm Frequency Stability:±40ppm Equivalent Series Resistance(ESR):80Ω Operating Temperature: Operating Temp; LCSC Part Name: 25MHz ±30ppm 6pF; Supplier Part: C6622770; Manufacturer: NDK; Supplier Footprint: SMD2016-4P; JLCPCB Part Class: Extended Part; Datasheet: https://atta.szlcsc.com/upload/public/pdf/source/231023/NX2016SA-25MHz-EXS00A-CS11365.pdf-f83ac946484d5b38b4c9eb87652f6316.pdf; Supplier: LCSC; Normal temperature Frequency Tolerance: ±30ppm; Frequency Stability: ±40ppm; Equivalent Series Resistance(ESR): 80Ω

## Nets
+3V3: C8.2 C9.1 C10.2 C15.2 C18.2 C21.2 C24.2 C30.2 C31.2 C32.2 C33.2 C34.2 C35.2 C44.2 C46.2 C47.2 L2.2 L8.1 LED17.1(+) R6.2 R7.2 R8.2 R102.2 R104.2 R105.2 R106.2 R107.2 R108.2 R120.1 R121.1 SW1.1 U3.5(VIO) U4.5(VIO) U5.5(VIO) U6.5(VIO) U19.5(VDDA33) U19.10(VDDA33) U19.13(CFG_SEL2) U19.43(RESET_N) U19.46(VDD33) U19.52(VDDA33) U19.57(VDDA33) U19.64(VDD33PLL) U21.7(VDD) U21.8(VBAT) U21.13(VDD) U21.16(VDDSMPS) U21.19(VDD) U21.32(VDD) U21.42(VDD) U21.56(VDD) U21.71(VDD) U21.79(VDD) U21.90(VDD50USB) U21.91(VDD33USB) U21.92(VDD) U21.106(VDD) U21.119(VDD) U21.129(VDD) U21.144(VDD) U22.4(VDD)
+5V: C1.2 C2.2 C3.1 C4.2 C12.1 C13.2 C14.2 C17.2 C20.2 C23.2 L1.2 R1.2 R10.2 R17.2 R21.2 R25.2 R29.2 U2.1(VIN) U3.3(VDD) U4.3(VDD) U5.3(VDD) U6.3(VDD)
+12V: C6.1 C7.2 C16.2 C19.2 C22.2 C25.2 C26.2 C27.2 C28.2 C29.2 D1.1(K) Q1.4(S) Q1.8(S) R4.1 U1.1(VIN) U7.5(V+) U8.5(V+) U9.5(V+) U10.5(V+) U11.11(IN) U16.11(IN) U17.11(IN) U18.11(IN)
GND: C1.1 C2.1 C3.2 C6.2 C7.1 C8.1 C9.2 C12.2 C13.1 C14.1 C15.1 C16.1 C17.1 C18.1 C19.1 C20.1 C21.1 C22.1 C23.1 C24.1 C25.1 C26.1 C27.1 C28.1 C29.1 C30.1 C31.1 C32.1 C33.1 C34.1 C35.1 C36.1 C37.1 C38.2 C39.1 C40.1 C41.1 C42.2 C43.1 C44.1 C45.2 C46.1 C47.1 C48.1 C49.1 C50.1 C51.1 C52.1 C53.2 D2.2 J1.5 LED1.1(K) LED2.1(K) LED3.1(K) LED4.1(K) LED5.3(K) LED5.4(K) LED6.3(K) LED6.4(K) LED7.3(K) LED7.4(K) LED8.3(K) LED8.4(K) LED9.3(K) LED9.4(K) LED10.3(K) LED10.4(K) LED11.3(K) LED11.4(K) LED12.3(K) LED12.4(K) LED13.2(C) LED14.2(C) LED15.2(C) LED16.2(C) Q2.2 Q3.2 Q4.2 Q5.2 Q6.2 Q7.2 Q8.2 Q9.2 R2.2 R3.2 R5.2 R9.1 R31.1 R32.1 R37.1 R42.1 R47.1 R48.1 R53.1 R54.1 R59.1 R60.1 R65.1 R66.1 R71.1 R72.1 R77.1 R78.1 R79.2 R80.2 R82.2 R83.2 R85.2 R86.2 R88.2 R89.2 R103.1 R115.2 R116.1 R117.2 R119.1 R123.2 SCREW1.1 SCREW2.1 SCREW3.1 SCREW4.1 U1.3(GND) U2.3(GND) U3.2(VSS) U3.9(EP) U4.2(VSS) U4.9(EP) U5.2(VSS) U5.9(EP) U6.2(VSS) U6.9(EP) U7.2(V-) U8.2(V-) U9.2(V-) U10.2(V-) U11.3(PGTH) U11.15(OVP) U11.16(GND) U12.1(EH) U12.2(EH) U12.3(EH) U12.4(EH) U12.5(EH) U12.6(EH) U12.A1(GND) U12.A12(GND) U12.B12(GND) U13.1(EH) U13.2(EH) U13.3(EH) U13.4(EH) U13.5(EH) U13.6(EH) U13.A1(GND) U13.A12(GND) U13.B12(GND) U14.1(EH) U14.2(EH) U14.3(EH) U14.4(EH) U14.5(EH) U14.6(EH) U14.A1(GND) U14.A12(GND) U14.B12(GND) U15.1(EH) U15.2(EH) U15.3(EH) U15.4(EH) U15.5(EH) U15.6(EH) U15.A1(GND) U15.A12(GND) U15.B12(GND) U16.3(PGTH) U16.15(OVP) U16.16(GND) U17.3(PGTH) U17.15(OVP) U17.16(GND) U18.3(PGTH) U18.15(OVP) U18.16(GND) U19.19(TEST) U21.14(VSSSMPS) U21.34(VSSA) U21.141(VSS) U22.6(VSS) U22.10(SHELL) U23.1(EH) U23.2(EH) U23.3(EH) U23.4(EH) U23.5(EH) U23.6(EH) U23.A1(GND) U23.A12(GND) U23.B1(GND) U23.B12(GND)
VBUS: C48.2 R122.1 U23.A4(VBUS) U23.A9(VBUS) U23.B4(VBUS) U23.B9(VBUS)
VBUS_DET: R122.2 R123.1 U19.44(VBUS_DET)
VDD18PLL: C51.2 C52.2 U19.62(VDD18PLL)
VDDA: C36.2 L8.2 U21.35(VREF+) U21.36(VDDA)
VDDLDO: C37.2 C39.2 C40.2 C41.2 L7.1 U21.17(VFBSMPS) U21.68(VCAP) U21.70(VDDLDO) U21.103(VCAP) U21.105(VDDLDO) U21.143(VDDLDO)
BTN: R103.2 SW1.2 U21.65(PE15) U21.135(BOOT0)
CAN0_EN: U3.8(STBY) U21.134(PB7)
CAN0_H: J2.2 L3.4 R11.2 R15.1 U12.A2(SSTXP1) U13.A2(SSTXP1) U14.A2(SSTXP1) U15.A2(SSTXP1)
CAN0_L: J2.1 L3.3 R11.1 R16.1 U12.A3(SSTXn1) U13.A3(SSTXn1) U14.A3(SSTXn1) U15.A3(SSTXn1)
CAN0_RX: U3.4(RXD) U21.136(PB8)
CAN0_TX: U3.1(TXD) U21.137(PB9)
CAN1_EN: U4.8(STBY) U21.130(PB3)
CAN1_H: J2.4 L4.4 R12.2 R19.1 U12.A11(SSRXp2) U13.A11(SSRXp2) U14.A11(SSRXp2) U15.A11(SSRXp2)
CAN1_L: J2.3 L4.3 R12.1 R20.1 U12.A10(SSRXn2) U13.A10(SSRXn2) U14.A10(SSRXn2) U15.A10(SSRXn2)
CAN1_RX: U4.4(RXD) U21.132(PB5)
CAN1_TX: U4.1(TXD) U21.133(PB6)
CAN2_EN: U5.8(STBY) U21.121(PD7)
CAN2_H: J2.6 L5.4 R13.2 R23.1 U12.B2(SSTXp2) U13.B2(SSTXp2) U14.B2(SSTXp2) U15.B2(SSTXp2)
CAN2_L: J2.5 L5.3 R13.1 R24.1 U12.B3(SSTXn2) U13.B3(SSTXn2) U14.B3(SSTXn2) U15.B3(SSTXn2)
CAN2_RX: U5.4(RXD) U21.123(PG10)
CAN2_TX: U5.1(TXD) U21.122(PG9)
CAN3_EN: U6.8(STBY) U21.131(PB4)
CAN3_H: J2.8 L6.4 R14.2 R27.1 U12.B11(SSRXp1) U13.B11(SSRXp1) U14.B11(SSRXp1) U15.B11(SSRXp1)
CAN3_L: J2.7 L6.3 R14.1 R28.1 U12.B10(SSRXn1) U13.B10(SSRXn1) U14.B10(SSRXn1) U15.B10(SSRXn1)
CAN3_RX: U6.4(RXD) U21.72(PB12)
CAN3_TX: U6.1(TXD) U21.73(PB13)
CH1_D_N: U12.A7(DN1) U12.B7(DN2) U19.1(USBDN1_DM/PRT_DIS_M1)
CH1_D_P: U12.A6(DP1) U12.B6(DP2) U19.2(USBDN1_DP/PRT_DIS_P1)
CH1_IMON: R80.1 U11.19(IMON) U21.47(PC4)
CH1_PWR_EN: U11.14(EN) U21.37(PA0)
CH1_SBU1: R33.2 R34.2 R96.2 U12.A8(SUB1)
CH1_SBU1_IGN: Q2.1 R31.2 R36.2 U21.112(PD0)
CH1_SBU1_RELAY: Q2.3 R32.2 R35.2 U21.113(PD1)
CH1_SBU2: R57.2 R58.2 R97.2 U12.B8(SUB2)
CH1_SBU2_IGN: Q6.1 R56.2 R59.2 U21.115(PD3)
CH1_SBU2_RELAY: Q6.3 R55.2 R60.2 U21.116(PD4)
CH2_D_N: U13.A7(DN1) U13.B7(DN2) U19.3(USBDN2_DM/PRT_DIS_M2)
CH2_D_P: U13.A6(DP1) U13.B6(DP2) U19.4(USBDN2_DP/PRT_DIS_P2)
CH2_IMON: R82.1 U16.19(IMON) U21.50(PB1)
CH2_PWR_EN: U16.14(EN) U21.38(PA1)
CH2_SBU1: R40.2 R41.2 R100.2 U13.A8(SUB1)
CH2_SBU1_IGN: Q3.1 R37.2 R39.2 U21.117(PD5)
CH2_SBU1_RELAY: Q3.3 R38.2 R42.2 U21.120(PD6)
CH2_SBU2: R63.2 R64.2 R98.2 U13.B8(SUB2)
CH2_SBU2_IGN: Q7.1 R62.2 R65.2 U21.76(PD8)
CH2_SBU2_RELAY: Q7.3 R61.2 R66.2 U21.78(PD10)
CH3_D_N: U14.A7(DN1) U14.B7(DN2) U19.6(USBDN3_DM/PRT_DIS_M3)
CH3_D_P: U14.A6(DP1) U14.B6(DP2) U19.7(USBDN3_DP/PRT_DIS_P3)
CH3_IMON: R85.1 U17.19(IMON) U21.52(PF11)
CH3_PWR_EN: U17.14(EN) U21.43(PA4)
CH3_SBU1: R45.2 R46.2 R94.2 U14.A8(SUB1)
CH3_SBU1_IGN: Q4.1 R44.2 R47.2 U21.82(PD12)
CH3_SBU1_RELAY: Q4.3 R43.2 R48.2 U21.81(PD11)
CH3_SBU2: R69.2 R70.2 R95.2 U14.B8(SUB2)
CH3_SBU2_IGN: Q8.1 R68.2 R71.2 U21.77(PD9)
CH3_SBU2_RELAY: Q8.3 R67.2 R72.2 U21.83(PD13)
CH4_D_N: U15.A7(DN1) U15.B7(DN2) U19.8(USBDN4_DM/PRT_DIS_M4)
CH4_D_P: U15.A6(DP1) U15.B6(DP2) U19.9(USBDN4_DP/PRT_DIS_P4)
CH4_IMON: R88.1 U18.19(IMON) U21.45(PA6)
CH4_PWR_EN: U18.14(EN) U21.44(PA5)
CH4_SBU1: R51.2 R52.2 R101.2 U15.A8(SUB1)
CH4_SBU1_IGN: Q5.1 R50.2 R53.2 U21.84(PD14)
CH4_SBU1_RELAY: Q5.3 R49.2 R54.2 U21.85(PD15)
CH4_SBU2: R75.2 R76.2 R99.2 U15.B8(SUB2)
CH4_SBU2_IGN: Q9.1 R74.2 R77.2 U21.138(PE0)
CH4_SBU2_RELAY: Q9.3 R73.2 R78.2 U21.139(PE1)
HUB_SCL: R120.2 U19.41(SCL/SMBCLK/CFG_SEL0) U21.66(PB10)
HUB_SDA: R121.2 U19.40(SDA/SMBDATA/NON_REM1) U21.67(PB11)
LED_B: R93.2 U21.1(PE2)
LED_G: R92.2 U21.2(PE3)
LED_R: R91.1 U21.3(PE4)
PH0: C42.1 U21.25(PH0-OSC_IN) X1.1
PH1: C43.2 U21.26(PH1-OSC_OUT) X1.3
SD_CLK: R114.2 U21.111(PC12)
SD_CMD: R113.2 U21.114(PD2)
SD_D0: R109.2 U21.95(PC8)
SD_D1: R110.2 U21.96(PC9)
SD_D2: R111.2 U21.109(PC10)
SD_D3: R112.2 U21.110(PC11)
STM_D_N: U19.55(USBDN7_DM/PRT_DIS_M7) U21.100(PA11)
STM_D_P: U19.56(USBDN7_DP/PRT_DIS_P7) U21.101(PA12)
USB_D_N: U19.58(USBUP_DM) U23.A7(DN1) U23.B7(DN2)
USB_D_P: U19.59(USBUP_DP) U23.A6(DP1) U23.B6(DP2)
VLXSMPS: C38.1 L7.2 U21.15(VLXSMPS)
$1N1259: D1.2(A) Q1.3(G) R5.1
$1N1313: D2.1 J1.3 Q1.1(D) Q1.2(D) Q1.5(D) Q1.6(D) Q1.7(D)
$1N13203: LED5.1(A) R36.1
$1N13246: Q2.5 R33.1
$1N13260: Q2.4 R34.1
$1N13283: R79.1 U11.17(ILIM)
$1N13322: LED13.1(A) R81.1
$1N13324: LED5.2(A) R35.1
$1N16078: R16.2 R17.1 U7.3(IN-)
$1N16234: LED1.2(A) R18.2
$1N24572: R105.1 R110.1 U22.8(DAT1)
$1N24631: R106.1 R111.1 U22.1(DAT2)
$1N24642: R107.1 R112.1 U22.2(CD/DAT3)
$1N24649: R114.1 U22.5(CLK)
$1N24659: R104.1 R109.1 U22.7(DAT0)
$1N24671: R108.1 R113.1 U22.3(CMD)
$1N24731: C5.2 L1.1 U1.2(SW)
$1N24732: C5.1 U1.4(BST)
$1N24733: C4.1 R1.1 R2.1 U1.6(FB)
$1N24736: R3.1 R4.2 U1.5(EN)
$1N24745: C11.2 L2.1 U2.2(SW)
$1N24746: C11.1 U2.4(BST)
$1N24747: C10.1 R6.1 R7.1 R8.1 R9.2 U2.6(FB)
$1N24748: R10.1 U2.5(EN)
$1N24760: L3.2 U3.6(CANL)
$1N24761: L3.1 U3.7(CANH)
$1N24762: L4.1 U4.7(CANH)
$1N24763: L4.2 U4.6(CANL)
$1N24773: L5.1 U5.7(CANH)
$1N24774: L5.2 U5.6(CANL)
$1N24784: L6.1 U6.7(CANH)
$1N24785: L6.2 U6.6(CANL)
$1N24845: R15.2 U7.1(IN+)
$1N24848: R18.1 U7.4(OUT)
$1N24879: R22.1 U8.4(OUT)
$1N24882: R19.2 U8.1(IN+)
$1N24886: LED2.2(A) R22.2
$1N24888: R20.2 R21.1 U8.3(IN-)
$1N24889: R26.1 U9.4(OUT)
$1N24890: R30.1 U10.4(OUT)
$1N24895: R23.2 U9.1(IN+)
$1N24896: R27.2 U10.1(IN+)
$1N24903: LED4.2(A) R30.2
$1N24904: LED3.2(A) R26.2
$1N24907: R28.2 R29.1 U10.3(IN-)
$1N24908: R24.2 R25.1 U9.3(IN-)
$1N24946: LED6.2(A) R38.1
$1N24947: Q3.4 R41.1
$1N24948: Q3.5 R40.1
$1N24949: LED6.1(A) R39.1
$1N24959: LED7.2(A) R43.1
$1N24960: Q4.4 R46.1
$1N24961: Q4.5 R45.1
$1N24962: LED7.1(A) R44.1
$1N24972: LED8.2(A) R49.1
$1N24973: Q5.4 R52.1
$1N24974: Q5.5 R51.1
$1N24975: LED8.1(A) R50.1
$1N25006: LED12.2(A) R73.1
$1N25007: LED11.2(A) R67.1
$1N25008: LED10.2(A) R61.1
$1N25009: LED9.2(A) R55.1
$1N25010: Q7.4 R64.1
$1N25011: Q9.4 R76.1
$1N25012: Q8.4 R70.1
$1N25013: Q6.4 R58.1
$1N25014: Q7.5 R63.1
$1N25015: Q9.5 R75.1
$1N25016: Q8.5 R69.1
$1N25017: Q6.5 R57.1
$1N25018: LED10.1(A) R62.1
$1N25019: LED12.1(A) R74.1
$1N25020: LED11.1(A) R68.1
$1N25021: LED9.1(A) R56.1
$1N25057: R81.2 U11.4(OUT) U12.A4(VBUS) U12.A9(VBUS) U12.B4(VBUS) U12.B9(VBUS)
$1N25065: R84.2 U13.A4(VBUS) U13.A9(VBUS) U13.B4(VBUS) U13.B9(VBUS) U16.4(OUT)
$1N25090: LED14.1(A) R84.1
$1N25091: R83.1 U16.17(ILIM)
$1N25094: R90.2 U15.A4(VBUS) U15.A9(VBUS) U15.B4(VBUS) U15.B9(VBUS) U18.4(OUT)
$1N25095: R87.2 U14.A4(VBUS) U14.A9(VBUS) U14.B4(VBUS) U14.B9(VBUS) U17.4(OUT)
$1N25144: LED16.1(A) R90.1
$1N25145: LED15.1(A) R87.1
$1N25146: R89.1 U18.17(ILIM)
$1N25147: R86.1 U17.17(ILIM)
$1N25148: LED17.4(B) R93.1
$1N25149: LED17.3(G) R92.1
$1N25150: LED17.2(R) R91.2
$1N25179: R94.1 U21.28(PC0)
$1N25180: R95.1 U21.29(PC1)
$1N25181: R96.1 U21.30(PC2_C)
$1N25182: R97.1 U21.31(PC3_C)
$1N25226: R98.1 U21.21(PF7)
$1N25227: R99.1 U21.22(PF8)
$1N25228: R100.1 U21.23(PF9)
$1N25229: R101.1 U21.24(PF10)
$1N25245: R102.1 U21.142(PDR_ON)
$1N25293: R115.1 U23.A5(CC1)
$1N25294: R116.2 U23.B5(CC2)
$1N25317: R117.1 U19.63(RBIAS)
$1N25319: C53.1 R118.1 U19.60(XTAL2) U20.1(OSC1)
$1N25320: C45.1 R118.2 U19.61(XTAL1/CLKIN) U20.3(OSC2)
$1N25323: R119.2 U19.45(SUSP_IND/LOCAL_PWR/NON_REM0)
$1N25345: C49.2 C50.2 U19.25(VDD18)

Not connected (* = marked no-connect by the designer): J1 4; U11 1(DMODE)* 2(PGOOD)* 5(OUT)* 6(OUT)* 7(OUT)* 8(OUT)* 9(IN)* 10(IN)* 12(IN)* 13(IN)* 18(dVdT)* 20(#FLT)* 21(EP)*; U12 A5(CC1)* B1(GND) B5(CC2)*; U13 A5(CC1)* B1(GND) B5(CC2)*; U14 A5(CC1)* B1(GND) B5(CC2)*; U15 A5(CC1)* B1(GND) B5(CC2)*; U16 1(DMODE)* 2(PGOOD)* 5(OUT)* 6(OUT)* 7(OUT)* 8(OUT)* 9(IN)* 10(IN)* 12(IN)* 13(IN)* 18(dVdT)* 20(#FLT)* 21(EP)*; U17 1(DMODE)* 2(PGOOD)* 5(OUT)* 6(OUT)* 7(OUT)* 8(OUT)* 9(IN)* 10(IN)* 12(IN)* 13(IN)* 18(dVdT)* 20(#FLT)* 21(EP)*; U18 1(DMODE)* 2(PGOOD)* 5(OUT)* 6(OUT)* 7(OUT)* 8(OUT)* 9(IN)* 10(IN)* 12(IN)* 13(IN)* 18(dVdT)* 20(#FLT)* 21(EP)*; U19 11(USBDN5_DM/PRT_DIS_M5)* 12(USBDN5_DP/PRT_DIS_P5)* 14(LED_B7_N)* 15(LED_A7_N/PRT_SWP7)* 16(LED_B6_N)* 17(LED_A6_N/PRT_SWP6)* 18(LED_B5_N)* 20(PRTPWR4)* 21(OCS4_N)* 22(OCS3_N)* 23(PRTPWR3)* 24(VDD33CR)* 26(PRTPWR2)* 27(OCS2_N)* 28(OCS1_N)* 29(PRTPWR1)* 30(PRTPWR5)* 31(LED_A5_N/PRT_SWP5)* 32(LED_B4_N)* 33(LED_A4_N/PRT_SWP4)* 34(LED_B3_N/GANG_EN)* 35(OCS5_N)* 36(PRTPWR7)* 37(OCS7_N)* 38(OCS6_N)* 39(PRTPWR6)* 42(HS_IND/CFG_SEL1)* 47(LED_A3_N/PRT_SWP3)* 48(LED_B2_N/BOOST1)* 49(LED_A2_N/PRT_SWP2)* 50(LED_B1_N/BOOST0)* 51(LED_A1_N/PRT_SWP1)* 53(USBDN6_DM/PRT_DIS_M6)* 54(USBDN6_DP/PRT_DIS_P6)* 65(EP); U20 2(GND)* 4(GND)*; U21 4(PE5)* 5(PE6)* 6(VSS)* 9(PC13)* 10(PC14-OSC32_IN)* 11(PC15-OSC32_OUT)* 12(VSS)* 18(VSS)* 20(PF6) 27(NRST) 33(VSS)* 39(PA2)* 40(PA3)* 41(VSS)* 46(PA7)* 48(PC5)* 49(PB0)* 51(PB2)* 53(PF14)* 54(PF15)* 55(VSS)* 57(PE7)* 58(PE8)* 59(PE9)* 60(PE10)* 61(PE11)* 62(PE12)* 63(PE13)* 64(PE14)* 69(VSS)* 74(PB14)* 75(PB15)* 80(VSS)* 86(PG6)* 87(PG7)* 88(PG8)* 89(VSS)* 93(PC6)* 94(PC7)* 97(PA8)* 98(PA9)* 99(PA10)* 102(PA13)* 104(VSS)* 107(PA14)* 108(PA15)* 118(VSS)* 124(PG11)* 125(PG12)* 126(PG13)* 127(PG14)* 128(VSS)* 140(VCAP)*; U22 9(SWITCH)*; U23 A2(SSTXP1)* A3(SSTXn1)* A8(SUB1)* A10(SSRXn2)* A11(SSRXp2)* B2(SSTXp2)* B3(SSTXn2)* B8(SUB2)* B10(SSRXn1)* B11(SSRXp1)*; X1 2(GND)* 4(GND)*

## Notes on the sheet
- POWER INPUT
- STM32 PROCESSOR
- USB HUB
- 3V3 POWER
- MOUNTING HOLES
- CAN MODULE 1
- CAN MODULE 2
- USB MODULE
- RELAY MODULES
- USB-C
- SD CARD
